# Altium schematic sheet Relay.SchDoc
size 300 x 200 mm; SheetNumber: 8; SheetTotal: 10
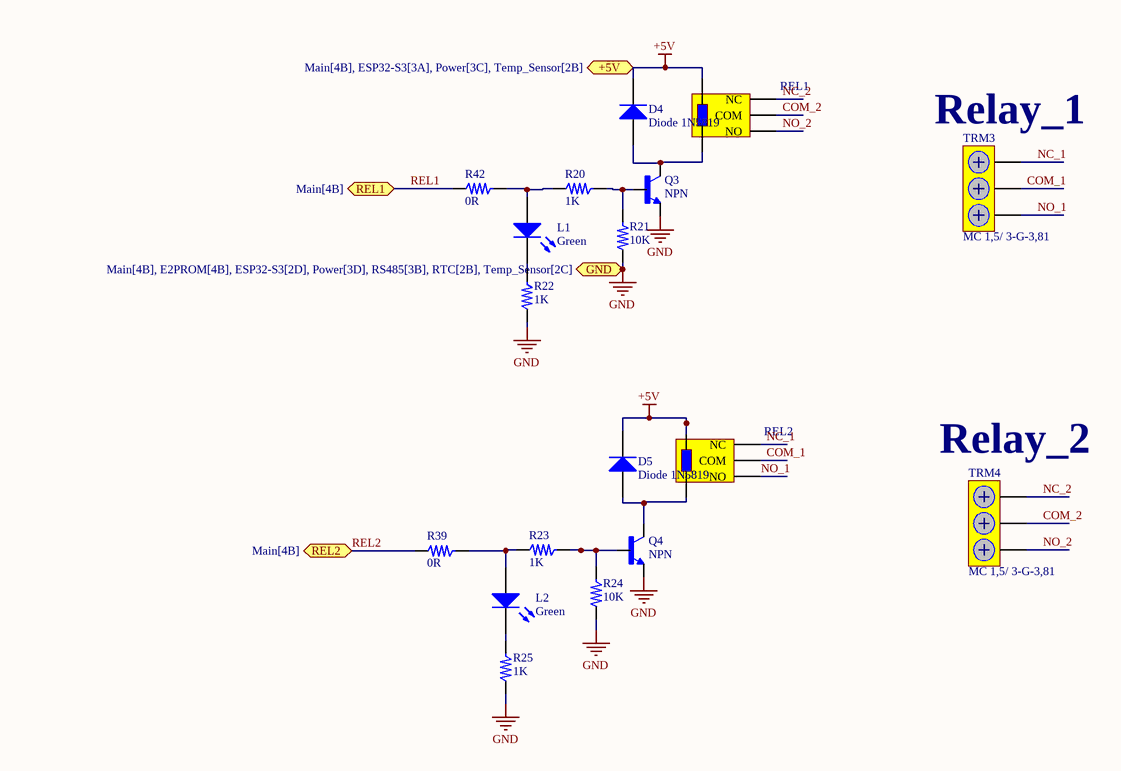
[diagram p0: Relay.SchDoc]

## Parts
D4  Diode 1N5819  [DO-214AA]
D5  Diode 1N5819  [DO-214AA]
L1  Green  [LED-1]
L2  Green  [LED-1]
Q3  NPN  [MMBT2222A]
Q4  NPN  [MMBT2222A]
R20  1K  [R0805]
R21  10K  [R0805]
R22  1K  [R0805]
R23  1K  [R0805]
R24  10K  [R0805]
R25  1K  [R0805]
R39  0R  [R0805]
R42  0R  [R0805]
REL1  Milon mini 5v relay  [HLS-T78-DC5V]  (value not drawn)
REL2  Milon mini 5v relay  [HLS-T78-DC5V]  (value not drawn)
TRM3  MC 1,5/ 3-G-3,81  [MC 1,5/ 3-G-3,81]
TRM4  MC 1,5/ 3-G-3,81  [MC 1,5/ 3-G-3,81]

## Ports
+5V (bidir, see Main[4B], ESP32-S3[3A], Power[3C], Temp_Sensor[2B]), GND (bidir, see Main[4B], E2PROM[4B], ESP32-S3[2D], Power[3D], RS485[3B], RTC[2B], Temp_Sensor[2C]), REL1 (bidir, see Main[4B]), REL2 (bidir, see Main[4B])

## Nets
+5V: D4.2(K) D5.2(K) REL1.3(Coil) REL2.3(Coil) ; port +5V
GND: Q3.2(E) Q4.2(E) R21.1 R22.1 R24.1 R25.1 ; port GND
COM_1: REL2.1(COM) TRM3.2
COM_2: REL1.1(COM) TRM4.2
NC_1: REL2.5(NC) TRM3.1
NC_2: REL1.5(NC) TRM4.1
NO_1: REL2.4(NO) TRM3.3
NO_2: REL1.4(NO) TRM4.3
REL1: R42.1 ; port REL1
REL2: R39.1 ; port REL2
NetD4_1: D4.1(A) Q3.3(C) REL1.2(Coil)
NetD5_1: D5.1(A) Q4.3(C) REL2.2(Coil)
NetL1_1: L1.1(A) R20.1 R42.2
NetL1_2: L1.2(K) R22.2
NetL2_1: L2.1(A) R23.1 R39.2
NetL2_2: L2.2(K) R25.2
NetQ3_1: Q3.1(B) R20.2 R21.2
NetQ4_1: Q4.1(B) R23.2 R24.2

## Notes on the sheet
- (near TRM3) Relay_1
- (near TRM4) Relay_2

## Library data of the parts
D4 D5 = Diode 1N4148: High Conductance Fast Diode; Published: 8-Jun-2000; LatestRevisionDate: 17-Jul-2002; LatestRevisionNote: Re-released for DXP Platform.; DatasheetVersion: 1997; PackageReference: DO-35; Publisher: Altium Limited; PackageDescription: Diode, Axial; Body 3.8 x 1.9 mm (LxDia. max), Lead Dia. 0.53 mm (max); Code_JEDEC: DO-204-AH; ComponentLink1Description: Manufacturer Link; ComponentLink1URL: http://www.fairchildsemi.com/; ComponentLink2Description: Datasheet; ComponentLink2URL: http://www.fairchildsemi.com/ds/1N%2F1N4148.pdf
L1 L2 = LED1_1: LEd 3 mil; Published: 8-Jun-2000; LatestRevisionDate: 08-Jul-2005; LatestRevisionNote: Mech Layer 1 removed.; PackageReference: LED-1; Publisher: Altium Limited; PackageDescription: LED; 2 Leads
Q3 Q4 = MMBT2222A
R20-R25 R39 R42 = myRes_1
  R20 R22 R23 R25: Value: 1K
  R21 R24: Value: 10K
  R39 R42: Value: 0R
REL1 REL2 = HLS-T78